# Altium schematic sheet Power_management.SchDoc: =DT_SCH_Title
size A3; Organization: Droid Technologies; SheetNumber: 5; SheetTotal: 22
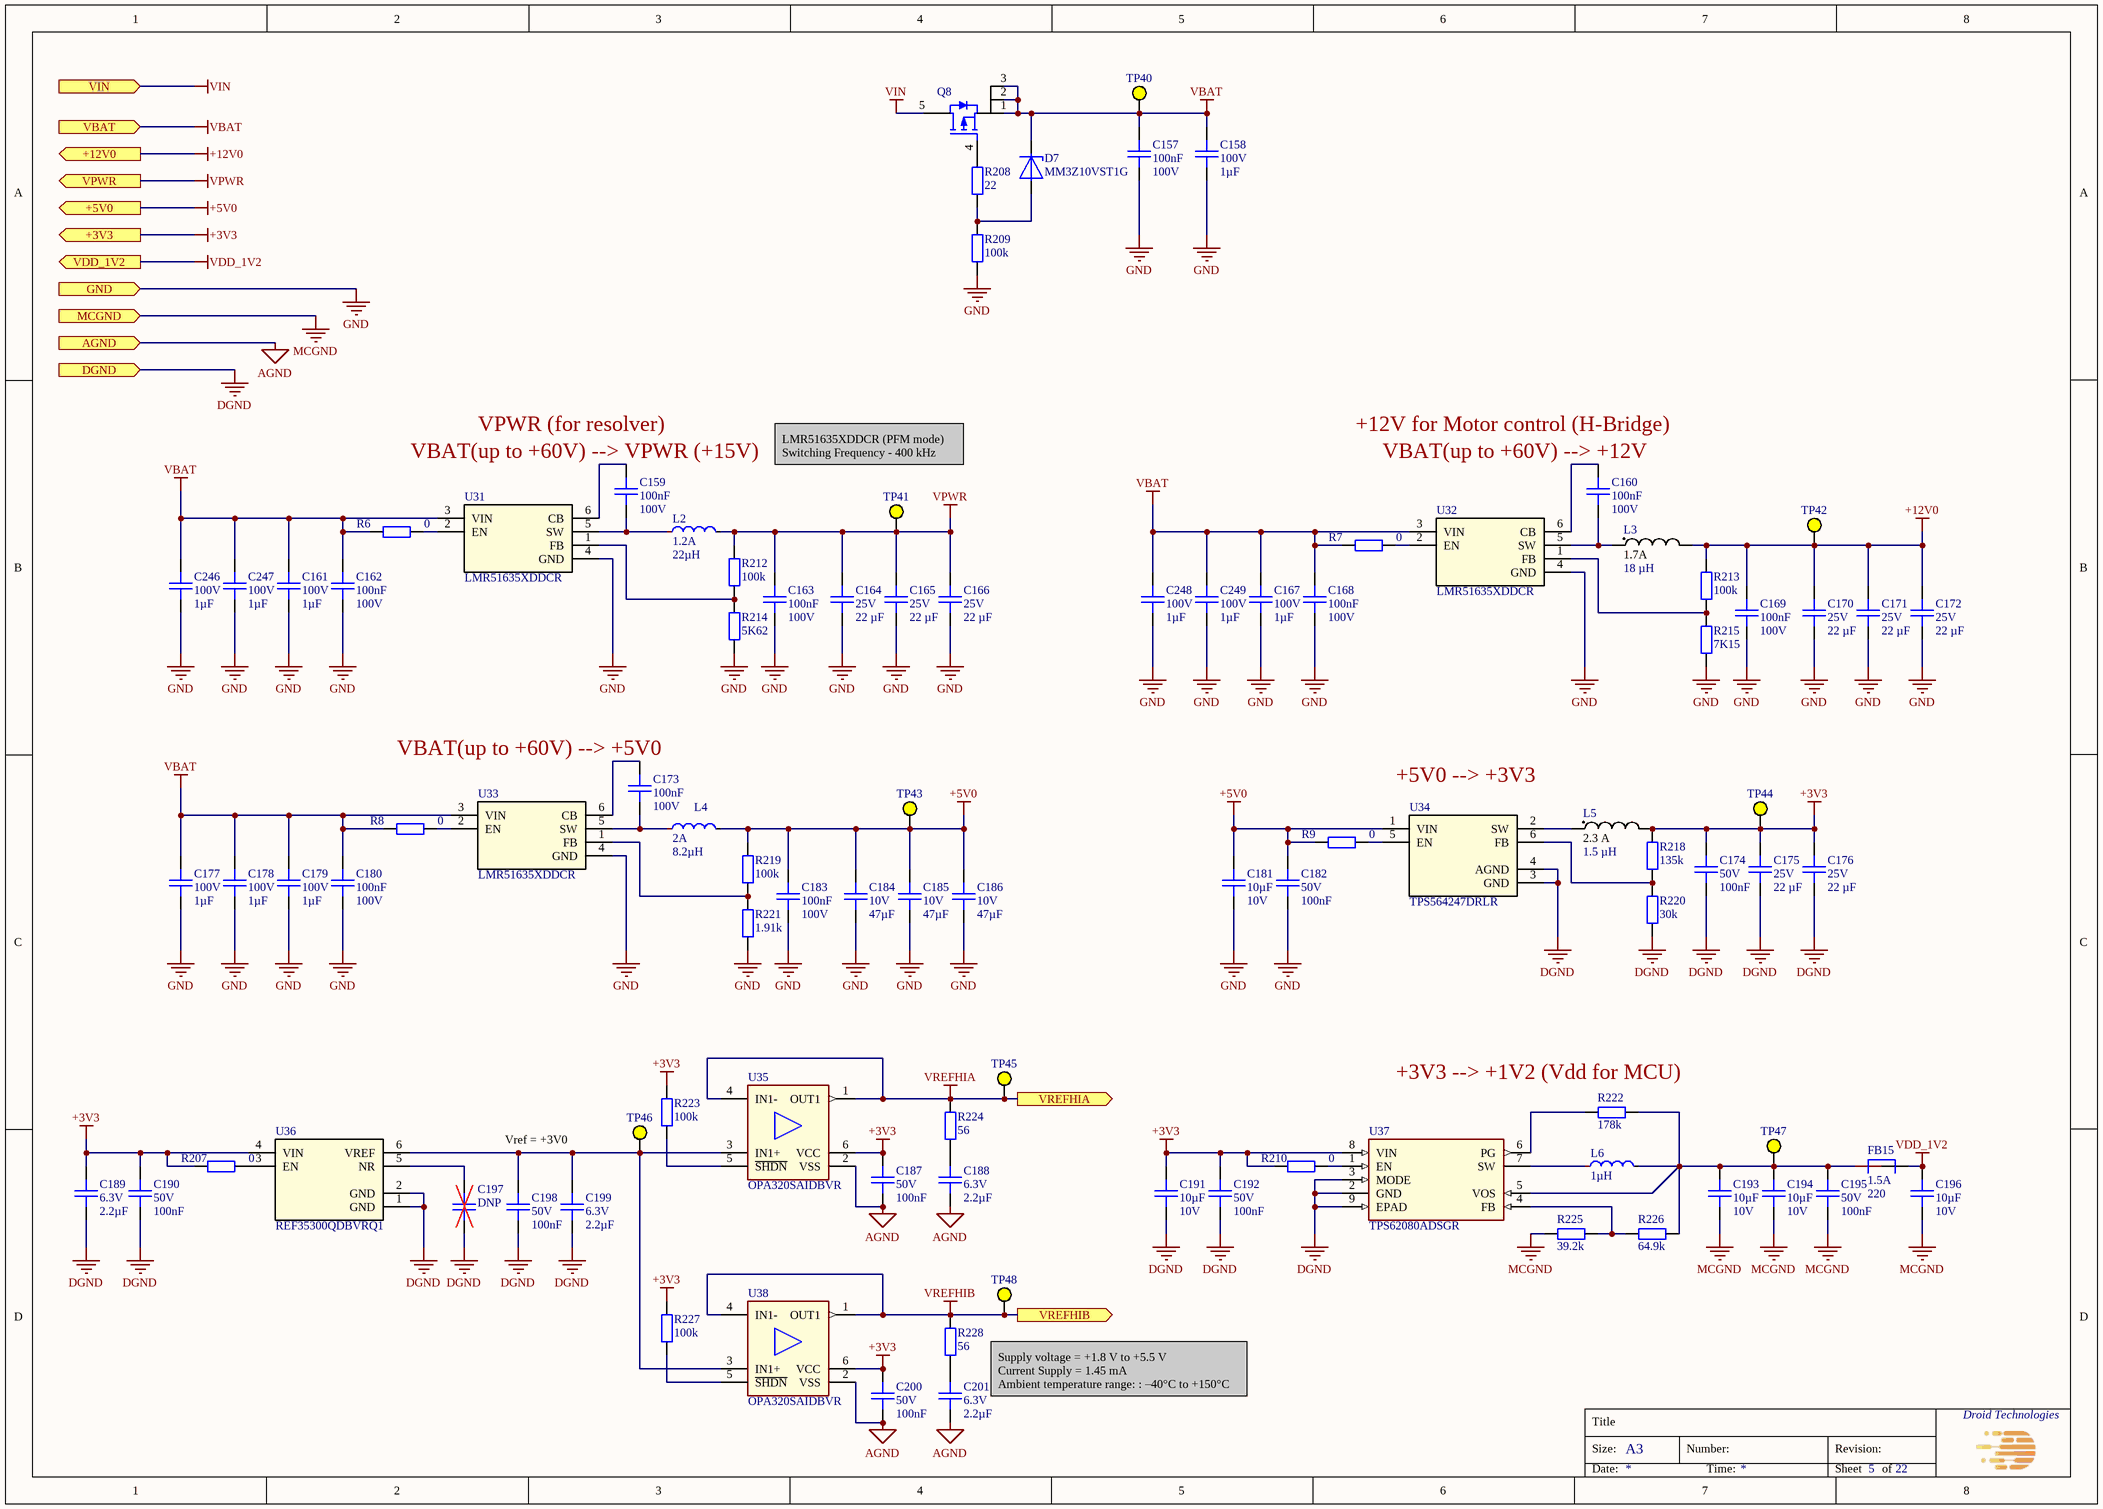
[diagram p0: Power_management.SchDoc]

## Parts
C157  Capacitance: 100nF  Voltage Rating: 100V  [CAPC160X80X90L35]  (hidden comment: GCJ188L8EL104KA07D)
C158  Voltage Rating: 100V  Capacitance: 1µF  [CAPC3216X180N]  (hidden comment: GCJ31CL8EL105KA07L)
C159  Capacitance: 100nF  Voltage Rating: 100V  [CAPC160X80X90L35]  (hidden comment: GCJ188L8EL104KA07D)
C160  Capacitance: 100nF  Voltage Rating: 100V  [CAPC160X80X90L35]  (hidden comment: GCJ188L8EL104KA07D)
C161  Voltage Rating: 100V  Capacitance: 1µF  [CAPC3216X180N]  (hidden comment: GCJ31CL8EL105KA07L)
C162  Capacitance: 100nF  Voltage Rating: 100V  [CAPC160X80X90L35]  (hidden comment: GCJ188L8EL104KA07D)
C163  Capacitance: 100nF  Voltage Rating: 100V  [CAPC160X80X90L35]  (hidden comment: GCJ188L8EL104KA07D)
C164  Voltage Rating: 25V  Capacitance: 22 µF  [CAPC3225_GCM32ER71E106KA57L]  (hidden comment: GCM32EL8EF226KE08L)
C165  Voltage Rating: 25V  Capacitance: 22 µF  [CAPC3225_GCM32ER71E106KA57L]  (hidden comment: GCM32EL8EF226KE08L)
C166  Voltage Rating: 25V  Capacitance: 22 µF  [CAPC3225_GCM32ER71E106KA57L]  (hidden comment: GCM32EL8EF226KE08L)
C167  Voltage Rating: 100V  Capacitance: 1µF  [CAPC3216X180N]  (hidden comment: GCJ31CL8EL105KA07L)
C168  Capacitance: 100nF  Voltage Rating: 100V  [CAPC160X80X90L35]  (hidden comment: GCJ188L8EL104KA07D)
C169  Capacitance: 100nF  Voltage Rating: 100V  [CAPC160X80X90L35]  (hidden comment: GCJ188L8EL104KA07D)
C170  Voltage Rating: 25V  Capacitance: 22 µF  [CAPC3225_GCM32ER71E106KA57L]  (hidden comment: GCM32EL8EF226KE08L)
C171  Voltage Rating: 25V  Capacitance: 22 µF  [CAPC3225_GCM32ER71E106KA57L]  (hidden comment: GCM32EL8EF226KE08L)
C172  Voltage Rating: 25V  Capacitance: 22 µF  [CAPC3225_GCM32ER71E106KA57L]  (hidden comment: GCM32EL8EF226KE08L)
C173  Capacitance: 100nF  Voltage Rating: 100V  [CAPC160X80X90L35]  (hidden comment: GCJ188L8EL104KA07D)
C174  Voltage Rating: 50V  Capacitance: 100nF  [CAPC100x50x50L25]  (hidden comment: GCM155L8EH104KE07D)
C175  Voltage Rating: 25V  Capacitance: 22 µF  [CAPC3225_GCM32ER71E106KA57L]  (hidden comment: GCM32EL8EF226KE08L)
C176  Voltage Rating: 25V  Capacitance: 22 µF  [CAPC3225_GCM32ER71E106KA57L]  (hidden comment: GCM32EL8EF226KE08L)
C177  Voltage Rating: 100V  Capacitance: 1µF  [CAPC3216X180N]  (hidden comment: GCJ31CL8EL105KA07L)
C178  Voltage Rating: 100V  Capacitance: 1µF  [CAPC3216X180N]  (hidden comment: GCJ31CL8EL105KA07L)
C179  Voltage Rating: 100V  Capacitance: 1µF  [CAPC3216X180N]  (hidden comment: GCJ31CL8EL105KA07L)
C180  Capacitance: 100nF  Voltage Rating: 100V  [CAPC160X80X90L35]  (hidden comment: GCJ188L8EL104KA07D)
C181  Capacitance: 10µF  Voltage Rating: 10V  [CAPC200X125X145L50]  (hidden comment: CGA4J1X8L1A106K125AC)
C182  Voltage Rating: 50V  Capacitance: 100nF  [CAPC100x50x50L25]  (hidden comment: GCM155L8EH104KE07D)
C183  Capacitance: 100nF  Voltage Rating: 100V  [CAPC160X80X90L35]  (hidden comment: GCJ188L8EL104KA07D)
C184  Voltage Rating: 10V  Capacitance: 47µF  [CAP_C2220_DOUBLE_KEM]  (hidden comment: C2220C476M8N2CAUTO)
C185  Voltage Rating: 10V  Capacitance: 47µF  [CAP_C2220_DOUBLE_KEM]  (hidden comment: C2220C476M8N2CAUTO)
C186  Voltage Rating: 10V  Capacitance: 47µF  [CAP_C2220_DOUBLE_KEM]  (hidden comment: C2220C476M8N2CAUTO)
C187  Voltage Rating: 50V  Capacitance: 100nF  [CAPC100x50x50L25]  (hidden comment: GCM155L8EH104KE07D)
C188  Voltage Rating: 6.3V  Capacitance: 2.2µF  [CAPC160X80X90L35]  (hidden comment: C1608X8L0J225K080AC)
C189  Voltage Rating: 6.3V  Capacitance: 2.2µF  [CAPC160X80X90L35]  (hidden comment: C1608X8L0J225K080AC)
C190  Voltage Rating: 50V  Capacitance: 100nF  [CAPC100x50x50L25]  (hidden comment: GCM155L8EH104KE07D)
C191  Capacitance: 10µF  Voltage Rating: 10V  [CAPC200X125X145L50]  (hidden comment: CGA4J1X8L1A106K125AC)
C192  Voltage Rating: 50V  Capacitance: 100nF  [CAPC100x50x50L25]  (hidden comment: GCM155L8EH104KE07D)
C193  Capacitance: 10µF  Voltage Rating: 10V  [CAPC200X125X145L50]  (hidden comment: CGA4J1X8L1A106K125AC)
C194  Capacitance: 10µF  Voltage Rating: 10V  [CAPC200X125X145L50]  (hidden comment: CGA4J1X8L1A106K125AC)
C195  Voltage Rating: 50V  Capacitance: 100nF  [CAPC100x50x50L25]  (hidden comment: GCM155L8EH104KE07D)
C196  Capacitance: 10µF  Voltage Rating: 10V  [CAPC200X125X145L50]  (hidden comment: CGA4J1X8L1A106K125AC)
C197  Capacitance: DNP  [CAPC100x50x50L25]  (hidden comment: DNP chip cap 0402)
C198  Voltage Rating: 50V  Capacitance: 100nF  [CAPC100x50x50L25]  (hidden comment: GCM155L8EH104KE07D)
C199  Voltage Rating: 6.3V  Capacitance: 2.2µF  [CAPC160X80X90L35]  (hidden comment: C1608X8L0J225K080AC)
C200  Voltage Rating: 50V  Capacitance: 100nF  [CAPC100x50x50L25]  (hidden comment: GCM155L8EH104KE07D)
C201  Voltage Rating: 6.3V  Capacitance: 2.2µF  [CAPC160X80X90L35]  (hidden comment: C1608X8L0J225K080AC)
C246  Voltage Rating: 100V  Capacitance: 1µF  [CAPC3216X180N]  (hidden comment: GCJ31CL8EL105KA07L)
C247  Voltage Rating: 100V  Capacitance: 1µF  [CAPC3216X180N]  (hidden comment: GCJ31CL8EL105KA07L)
C248  Voltage Rating: 100V  Capacitance: 1µF  [CAPC3216X180N]  (hidden comment: GCJ31CL8EL105KA07L)
C249  Voltage Rating: 100V  Capacitance: 1µF  [CAPC3216X180N]  (hidden comment: GCJ31CL8EL105KA07L)
D7  MM3Z10VST1G  [SOD250X125X110L30X40]
FB15  Imax: 1.5A  Impedance: 220  [BEADC160X80X95L40]  (hidden comment: BLM18KG221BH1D)
L2  I: 1.2A  Inductance: 22µH  [BOURNS_SRP4020TA]  (hidden comment: SRP4020TA-220M)
L3  Current Rating (Amps): 1.7A  Inductance: 18 µH  [IND_SRR4828A180M]  (hidden comment: SRR4828A-180M)
L4  I: 2A  Inductance: 8.2µH  [BOURNS_SRP4020TA]  (hidden comment: SRP4020TA-8R2M)
L5  Current Rating (Amps): 2.3 A  Inductance: 1.5 µH  [IND_DFE2HCAH1R0MJ0L]  (hidden comment: DFE2HCAH1R5MJ0L)
L6  Inductance: 1µH  [INDC250X200X120L60]  (hidden comment: DFE2HCAH1R0MJ0L)
Q8  SQJ185ELP-T1_GE3  [POWERPAK SO-8L_VIS]  (value not drawn)
R6  Resistance: 0  [RESC100X50X40L25]  (hidden comment: RC0402FR-070RL)
R7  Resistance: 0  [RESC100X50X40L25]  (hidden comment: RC0402FR-070RL)
R8  Resistance: 0  [RESC100X50X40L25]  (hidden comment: RC0402FR-070RL)
R9  Resistance: 0  [RESC100X50X40L25]  (hidden comment: RC0402FR-070RL)
R207  Resistance: 0  [RESC100X50X40L25]  (hidden comment: RC0402FR-070RL)
R208  Resistance: 22  [RESC100X50X40L25]  (hidden comment: RC0402FR-0722RL)
R209  Resistance: 100k  [RESC100X50X40L25]  (hidden comment: RC0402FR-07100KL)
R210  Resistance: 0  [RESC100X50X40L25]  (hidden comment: RC0402FR-070RL)
R212  Resistance: 100k  [RESC100X50X40L25]  (hidden comment: RC0402FR-07100KL)
R213  Resistance: 100k  [RESC100X50X40L25]  (hidden comment: RC0402FR-07100KL)
R214  Resistance: 5K62  [RC0402N_PAN]  (hidden comment: ERJ-2RKF5621X)
R215  Resistance: 7K15  [RC0402N_PAN]  (hidden comment: ERJ-2RKF7151X)
R218  Resistance: 135k  [RESC100X50X40L25]  (hidden comment: RN73H1ETTP1353F50)
R219  Resistance: 100k  [RESC100X50X40L25]  (hidden comment: RC0402FR-07100KL)
R220  Resistance: 30k  [RESC100X50X40L25]  (hidden comment: RC0402FR-0730KL)
R221  Resistance: 1.91k  [RESC100X50X40L25]  (hidden comment: RC0402FR-071K91L)
R222  Resistance: 178k  [RESC100X50X40L25]  (hidden comment: RC0402FR-07178KL)
R223  Resistance: 100k  [RESC100X50X40L25]  (hidden comment: RC0402FR-07100KL)
R224  Resistance: 56  [RESC100X50X40L25]  (hidden comment: RC0402FR-0756RL)
R225  Resistance: 39.2k  [RESC100X50X40L25]  (hidden comment: RMCF0402FT39K2)
R226  Resistance: 64.9k  [RESC100X50X40L25]  (hidden comment: RC0402FR-0764K9L)
R227  Resistance: 100k  [RESC100X50X40L25]  (hidden comment: RC0402FR-07100KL)
R228  Resistance: 56  [RESC100X50X40L25]  (hidden comment: RC0402FR-0756RL)
TP40  Test Point  [TP_D0.75mm]  (value not drawn)  (no BOM)
TP41  Test Point  [TP_D0.75mm]  (value not drawn)  (no BOM)
TP42  Test Point  [TP_D0.75mm]  (value not drawn)  (no BOM)
TP43  Test Point  [TP_D0.75mm]  (value not drawn)  (no BOM)
TP44  Test Point  [TP_D0.75mm]  (value not drawn)  (no BOM)
TP45  Test Point  [TP_D0.75mm]  (value not drawn)  (no BOM)
TP46  Test Point  [TP_D0.75mm]  (value not drawn)  (no BOM)
TP47  Test Point  [TP_D0.75mm]  (value not drawn)  (no BOM)
TP48  Test Point  [TP_D0.75mm]  (value not drawn)  (no BOM)
U31  LMR51635XDDCR  [DDC0006A-MFG]
U32  LMR51635XDDCR  [DDC0006A-MFG]
U33  LMR51635XDDCR  [DDC0006A-MFG]
U34  TPS564247DRLR  [SOT5x3-6_DRL_TEX]
U35  OPA320SAIDBVR  [SOT-23-6]
U36  REF35300QDBVRQ1  [SOT23-6_DBV_TEX]
U37  TPS62080ADSGR  [WSON (8) 2*2mm]
U38  OPA320SAIDBVR  [SOT-23-6]

## Ports
+3V3 (out), +5V0 (out), +12V0 (out), AGND (in), DGND (in), GND (in), MCGND (in), VBAT (in), VDD_1V2 (out), VIN (in), VPWR (out), VREFHIA (out), VREFHIB (out)

## Nets
+3V3: C174.2 C175.2 C176.2 C187.2 C189.2 C190.2 C191.2 C192.2 C200.2 L5.2 R207.1 R210.1 R218.2 R223.2 R227.2 TP44.1 U35.6(VCC) U36.4(VIN) U37.8(VIN) U38.6(VCC) ; port +3V3
+5V0: C181.2 C182.2 C183.2 C184.2 C185.2 C186.2 L4.2 R9.1 R219.2 TP43.1 U34.1(VIN) ; port +5V0
+12V0: C169.2 C170.2 C171.2 C172.2 L3.2 R213.2 TP42.1 ; port +12V0
AGND: C187.1 C188.1 C200.1 C201.1 U35.2(VSS) U38.2(VSS) ; port AGND
DGND: C174.1 C175.1 C176.1 C189.1 C190.1 C191.1 C192.1 C197.1 C198.1 C199.1 R220.1 U34.3(GND) U34.4(AGND) U36.1(GND) U36.2(GND) U37.2(GND) U37.3(MODE) U37.9(EPAD) ; port DGND
GND: C157.1 C158.1 C161.1 C162.1 C163.1 C164.1 C165.1 C166.1 C167.1 C168.1 C169.1 C170.1 C171.1 C172.1 C177.1 C178.1 C179.1 C180.1 C181.1 C182.1 C183.1 C184.1 C185.1 C186.1 C246.1 C247.1 C248.1 C249.1 R209.1 R214.1 R215.1 R221.1 U31.4(GND) U32.4(GND) U33.4(GND) ; port GND
MCGND: C193.1 C194.1 C195.1 C196.1 R225.1 ; port MCGND
VBAT: C157.2 C158.2 C161.2 C162.2 C167.2 C168.2 C177.2 C178.2 C179.2 C180.2 C246.2 C247.2 C248.2 C249.2 D7.1 Q8.1 Q8.2 Q8.3 R6.1 R7.1 R8.1 TP40.1 U31.3(VIN) U32.3(VIN) U33.3(VIN) ; port VBAT
VDD_1V2: C196.2 FB15.2 ; port VDD_1V2
VIN: Q8.5 ; port VIN
VPWR: C163.2 C164.2 C165.2 C166.2 L2.2 R212.2 TP41.1 ; port VPWR
VREFHIA: R224.2 TP45.1 U35.1(OUT1) U35.4(IN1-) ; port VREFHIA
VREFHIB: R228.2 TP48.1 U38.1(OUT1) U38.4(IN1-) ; port VREFHIB
NetC159_1: C159.1 L2.1 U31.5(SW)
NetC159_2: C159.2 U31.6(CB)
NetC160_1: C160.1 L3.1 U32.5(SW)
NetC160_2: C160.2 U32.6(CB)
NetC173_1: C173.1 L4.1 U33.5(SW)
NetC173_2: C173.2 U33.6(CB)
NetC188_2: C188.2 R224.1
NetC193_2: C193.2 C194.2 C195.2 FB15.1 L6.2 R222.2 R226.2 TP47.1 U37.5(VOS)
NetC197_2: C197.2 U36.5(NR)
NetC198_2: C198.2 C199.2 TP46.1 U35.3(IN1+) U36.6(VREF) U38.3(IN1+)
NetC201_2: C201.2 R228.1
NetD7_2: D7.2 R208.1 R209.2
NetL5_1: L5.1 U34.2(SW)
NetL6_1: L6.1 U37.7(SW)
NetQ8_4: Q8.4 R208.2
NetR6_2: R6.2 U31.2(EN)
NetR7_2: R7.2 U32.2(EN)
NetR8_2: R8.2 U33.2(EN)
NetR9_2: R9.2 U34.5(EN)
NetR207_2: R207.2 U36.3(EN)
NetR210_2: R210.2 U37.1(EN)
NetR212_1: R212.1 R214.2 U31.1(FB)
NetR213_1: R213.1 R215.2 U32.1(FB)
NetR218_1: R218.1 R220.2 U34.6(FB)
NetR219_1: R219.1 R221.2 U33.1(FB)
NetR222_1: R222.1 U37.6(PG)
NetR223_1: R223.1 U35.5(~{SHDN})
NetR225_2: R225.2 R226.1 U37.4(FB)
NetR227_1: R227.1 U38.5(~{SHDN})

## Notes on the sheet
- (near C159) VBAT(up to +60V) --> VPWR (+15V)
- (near C159) VPWR (for resolver)
- (near C160) +12V for Motor control (H-Bridge)
- (near C160) VBAT(up to +60V) --> +12V
- LMR51635XDDCR (PFM mode)
  Switching Frequency - 400 kHz
- (near C173) VBAT(up to +60V) --> +5V0
- +5V0 --> +3V3
- (near R222) +3V3 --> +1V2 (Vdd for MCU)
- Vref = +3V0
- Supply voltage = +1.8 V to +5.5 V
  Current Supply = 1.45 mA
  Ambient temperature range: : –40°C to +150°C
- Title
- Size:
- A3
- Number:
- Revision:
- Date:
- Time:
- Sheet
- of

## Library data of the parts
C157 C159 C160 C162 C163 C168 C169 C173 C180 C183 = CMP-001-2003-2: CAP CER 0.1UF 100V X8L 0603; Manufacturer: Murata Electronics; Tolerance: 10%; Op Temp min: -55°C; Op Temp max: 150°C; Package: 0603 (1608 Metric); ComponentLink3URL: https://www.digikey.com/en/products/detail/murata-electronics/GCJ188L8EL104KA07D/11618648; Lead Spacing: 0mm; ComponentLink1Description: Datasheet; ComponentLink1URL: https://www.murata.com/en-us/products/productdetail?partno=GCJ188L8EL104KA07%23; ComponentLink3Description: Digikey; MPN: GCJ188L8EL104KA07D; Ratings: AEC-Q200; ComponentLink2Description: Mouser; Height max: 900µm; Dielectric: X8L; Mounting Type: SM; ComponentLink2URL: https://eu.mouser.com/ProductDetail/Murata-Electronics/GCJ188L8EL104KA07D?qs=rrS6PyfT74fTpbPMbkPm2A%3D%3D; Size: 1.60mm x 0.80mm
C158 C161 C167 C177-C179 C246-C249 = CAP_1206_GCJ31CL8EL105KA07L: CAP CER 1UF 100V X8L 1206; Manufacturer: Murata Electronics; Op Temp max: 150°C; Op Temp min: -55°C; Tolerance: ±10%; ComponentLink3URL: https://www.digikey.gr/en/products/detail/murata-electronics/GCJ31CL8EL105KA07L/11618584; MPN: GCJ31CL8EL105KA07L; ComponentLink1URL: https://www.murata.com/en-sg/api/pdfdownloadapi?cate=luCeramicCapacitorsSMD&partno=GCJ31CL8EL105KA07%23; Package: 1206 (3216 Metric); Size: 3.20mm x 1.60mm; Height max: 1.90mm; Mounting Type: SM; ComponentLink1Description: Datasheet; ComponentLink3Description: Digikey; Ratings: AEC-Q200; Dielectric: X8L; Lead Spacing: -; Component Type: Ceramic Capacitor; Features: Soft Termination; ComponentLink4Description: Mouser; ComponentLink4URL: https://eu.mouser.com/ProductDetail/Murata-Electronics/GCJ31CL8EL105KA07L?qs=rrS6PyfT74eZHHvssdJSWA%3D%3D
C164-C166 C170-C172 C175 C176 = CAP_1210_GCM32EL8EF226KE08L: CAP CER 22UF 25V X8L 1210; Manufacturer: Murata Electronics; Op Temp max: 150°C; Op Temp min: -55°C; Tolerance: ±10%; ComponentLink3URL: https://www.digikey.gr/en/products/detail/murata-electronics/GCM32EL8EF226KE08L/10691974; MPN: GCM32EL8EF226KE08L; ComponentLink1URL: https://search.murata.co.jp/Ceramy/image/img/A01X/G101/ENG/GCM32EL8EF226KE08-01A.pdf; Package: 1210 (3225 Metric); Size: 3.20mm x 2.50mm; Height max: 2.85mm; Mounting Type: SM; ComponentLink1Description: Datasheet; ComponentLink3Description: Digikey; Ratings: AEC-Q200; Dielectric: X8L; Lead Spacing: -; Component Type: Ceramic Capacitor; ComponentLink4Description: Mouser; ComponentLink4URL: https://eu.mouser.com/ProductDetail/Murata-Electronics/GCM32EL8EF226KE08L?qs=rrS6PyfT74dnuZSDrFnfTA%3D%3D
C174 C182 C187 C190 C192 C195 C198 C200 = CMP-001-1980-2: CAP CER 0.1UF 50V X8L 0402; Manufacturer: Murata Electronics; Op Temp max: 150°C; Op Temp min: -55°C; Tolerance: 10%; Height max: 550µm; ComponentLink3Description: Digikey; Mounting Type: SM; ComponentLink3URL: https://www.digikey.com/en/products/detail/murata-electronics/GCM155L8EH104KE07D/11618823; Package: 0402 (1005 Metric); Lead Spacing: 0mm; MPN: GCM155L8EH104KE07D; Size: 1.00mm x 0.50mm; Ratings: AEC-Q200; ComponentLink1URL: https://www.murata.com/en-us/products/productdetail?partno=GCM155L8EH104KE07%23; ComponentLink1Description: Datasheet; Dielectric: X8L; ComponentLink2Description: Mouser; ComponentLink2URL: https://eu.mouser.com/ProductDetail/Murata-Electronics/GCM155L8EH104KE07D?qs=1mbolxNpo8fQSHf0HYnZWw%3D%3D
C181 C191 C193 C194 C196 = CMP-001-1984-2: CAP CER 10UF 10V X8L 0805; Manufacturer: TDK Corporation; Tolerance: 10%; Op Temp min: -55°C; Op Temp max: 150°C; ComponentLink3Description: Digikey; Mounting Type: SM; Ratings: AEC-Q200; ComponentLink1Description: Datasheet; ComponentLink3URL: https://www.digikey.com/en/products/detail/tdk-corporation/CGA4J1X8L1A106K125AC/9991388; Lead Spacing: 0mm; MPN: CGA4J1X8L1A106K125AC; Size: 2.00mm x 1.25mm; Height max: 1.5mm; ComponentLink2URL: https://eu.mouser.com/ProductDetail/TDK/CGA4J1X8L1A106K125AC?qs=gZXFycFWdANzH%252B2UvJJjtQ%3D%3D; Package: 0805 (2012 Metric); ComponentLink2Description: Mouser; Dielectric: X8L; ComponentLink1URL: https://product.tdk.com/en/search/capacitor/ceramic/mlcc/info?part_no=CGA4J1X8L1A106K125AC
C184-C186 = CAP_2220_C2220C476M8N2CAUTO: CAP CER 47UF 10V X8L SMD; Manufacturer: KEMET; Op Temp max: 150°C; Op Temp min: -55°C; Tolerance: ±20%; ComponentLink3URL: https://www.digikey.gr/en/products/detail/kemet/C2220C476M8N2CAUTO/8342190; MPN: C2220C476M8N2CAUTO; ComponentLink1URL: https://content.kemet.com/datasheets/KEM_C1038_X8L_KPS_150C_SMD.pdf; Package: Stacked SMD, 2 J-Lead; Size: 6.00mm x 5.00mm; Height max: 5.50mm; Mounting Type: SM; ComponentLink1Description: Datasheet; ComponentLink3Description: Digikey; Ratings: AEC-Q200; Dielectric: X8L; Lead Spacing: 0mm; Component Type: Ceramic Capacitor; ComponentLink4Description: Mouser; ComponentLink4URL: https://eu.mouser.com/ProductDetail/KEMET/C2220C476M8N2CAUTO?qs=r5DSvlrkXmIgGb2bhHfNGg%3D%3D
C188 C189 C199 C201 = CMP-001-2044-2: CAP CER 2.2UF 6.3V X8L 0603; Manufacturer: TDK Corporation; Op Temp min: -55°C; Tolerance: 10%; Op Temp max: 150°C; ComponentLink1URL: https://product.tdk.com/en/search/capacitor/ceramic/mlcc/info?part_no=C1608X8L0J225K080AC; MPN: C1608X8L0J225K080AC; ComponentLink3URL: https://www.digikey.com/en/products/detail/tdk-corporation/C1608X8L0J225K080AC/8343784; ComponentLink1Description: Datasheet; Lead Spacing: 0mm; ComponentLink3Description: Digikey; Package: 0603 (1608 Metric); Height max: 900µm; Size: 1.60mm x 0.80mm; Dielectric: X8L; Ratings: -; Mounting Type: SM; ComponentLink2URL: https://eu.mouser.com/ProductDetail/TDK/C1608X8L0J225K080AC?qs=rrS6PyfT74dgREMaiAoT3Q%3D%3D; ComponentLink2Description: Mouser
C197 = CMP-00427-4: DNP cap 0402; Mounting Type: SM; Package: 0402 (1005 Metric); MPN: DNP
D7 = CMP-001-1211-3: DIODE ZENER 10V 300MW SOD323; Manufacturer: onsemi; Voltage - Forward (Vf) (Max) @ If: 900 mV @ 10 mA; Impedance (Max) (Zzt): 15; Op Temp min: -65°C; Tolerance: 2%; Op Temp max: 150°C; Current - Reverse Leakage @ Vr: 500 nA @ 6 V; ComponentLink1Description: Datasheet; Size: 2.50mm x 1.25mm; Voltage - Zener (Nom) (Vz): 10V; MPN: MM3Z10VST1G; ComponentLink2URL: https://eu.mouser.com/ProductDetail/onsemi/MM3Z10VST1G?qs=HVbQlW5zcXXzjT3ckAO0iA%3D%3D; Mounting Type: SM; Height max: 1.1mm; Power: 300mW; Package: SC-76, SOD-323; ComponentLink3Description: Digikey; ComponentLink1URL: https://www.onsemi.com/pdf/datasheet/mm3z2v4st1-d.pdf; ComponentLink2Description: Mouser; ComponentLink3URL: https://www.digikey.com/en/products/detail/on-semiconductor/MM3Z10VST1G/687052
FB15 = CMP-001-1981-1: FERRITE BEAD 220 OHM 0603 1LN; Manufacturer: Murata Electronics; DCR: 50m; Op Temp min: -55°C; Frequency: 100MHz; Op Temp max: 150°C; Number of Lines: 1; Mounting Type: SM; Size: 1.60mm x 0.80mm; ComponentLink2URL: https://eu.mouser.com/ProductDetail/Murata-Electronics/BLM18KG221BH1D?qs=sJ5gq5MLFXpgEHYBdWUtkQ%3D%3D; ComponentLink1Description: Datasheet; ComponentLink1URL: https://www.murata.com/en-us/products/productdata/8798137286686/QNFA9129.pdf; Lead Spacing: 0mm; Ratings: AEC-Q200; ComponentLink3Description: Digikey; ComponentLink3URL: https://www.digikey.com/en/products/detail/murata-electronics/BLM18KG221BH1D/6156000; Height max: 950µm; Package: 0603 (1608 Metric); ComponentLink2Description: Mouser; MPN: BLM18KG221BH1D
L2 = CMP-00887-1: FIXED IND 22UH 1.2A 500 MOHM SMD; Manufacturer: Bourns Inc.; Type: Drum Core, Wirewound; Op Temp max: 150°C; Fsr: 19MHz; DCR: 0.5; Shielding: Shielded; Material - Core: Carbonyl Powder; Tolerance: 20%; Isat: 1.4A; Op Temp min: -40°C; Mounting Type: SM; ComponentLink3URL: https://www.digikey.com/en/products/detail/bourns-inc/SRP4020TA-220M/6153694?s=N4IgTCBcDaIAQGUBKAFALABjBgKgQQFoxsBZEAXQF8g; MPN: SRP4020TA-220M; ComponentLink2URL: https://eu.mouser.com/ProductDetail/Bourns/SRP4020TA-220M?qs=6oMev5NRZMH3jbGE7KrwKQ%3D%3D; ComponentLink3Description: Digikey; Height max: 2mm; Ratings: AEC-Q200; ComponentLink1Description: Datasheet; Lead Spacing: 0mm; Size: 4.45mm x 4.06mm; ComponentLink1URL: https://www.bourns.com/docs/Product-Datasheets/SRP4020TA.pdf; Package: 2-SMD; ComponentLink2Description: Mouser
L3 = IND_SRR4828A-180M: FIXED IND 18UH 1.7A 160 MOHM SMD; Manufacturer: Bourns Inc.; Current - Saturation (Isat): 0.8A; Shielding: Shielded; Frequency - Self Resonant: 22MHz; Inductance Frequency - Test: 100 kHz; Type: Drum Core, Wirewound; Material - Core: Ferrite; Tolerance: ±20%; MPN: SRR4828A-180M; DC Resistance (DCR): 160mOhm; ComponentLink1Description: DigiKey; ComponentLink1URL: https://www.digikey.com/en/products/detail/bourns-inc/SRR4828A-180M/7556024; ComponentLink2Description: Datasheet; ComponentLink2URL: https://www.bourns.com/docs/Product-Datasheets/SRR4828A.pdf; Mounting Type: SM; Ratings: AEC-Q200; Q @ Freq: -; ComponentLink3Description: Mouser; ComponentLink3URL: https://eu.mouser.com/ProductDetail/Bourns/SRR4828A-180M?qs=EU6FO9ffTwc4nWVXADcZcw%3D%3D
L4 = CMP-00885-1: FIXED IND 8.2UH 2A 180 MOHM SMD; Manufacturer: Bourns Inc.; Type: Drum Core, Wirewound; Op Temp min: -40°C; Material - Core: Carbonyl Powder; DCR: 0.18; Op Temp max: 150°C; Tolerance: 20%; Isat: 2.5A; Fsr: 21MHz; Shielding: Shielded; Ratings: AEC-Q200; ComponentLink3Description: Digikey; ComponentLink2Description: Mouser; Height max: 2mm; Lead Spacing: 0mm; ComponentLink1Description: Datasheet; Package: 2-SMD; ComponentLink3URL: https://www.digikey.com/en/products/detail/bourns-inc/SRP4020TA-8R2M/4901009?s=N4IgTCBcDaIMoCUAKAWADGNAVAggWgA4EwBZEAXQF8g; ComponentLink2URL: https://eu.mouser.com/ProductDetail/Bourns/SRP4020TA-8R2M?qs=Ph8%2FHnX6CQwwXiBs8JjSfQ%3D%3D; Size: 4.45mm x 4.06mm; MPN: SRP4020TA-8R2M; ComponentLink1URL: https://www.bourns.com/docs/Product-Datasheets/SRP4020TA.pdf; Mounting Type: SM
L5 = IND_DFE2HCAH1R5MJ0L: FIXED IND 1.5UH 2.3A 74 MOHM SMD; Manufacturer: Murata Electronics; Current - Saturation (Isat): 2.9A; Shielding: Shielded; DC Resistance (DCR): 74mOhm Max; Inductance Frequency - Test: 1 MHz; Type: Drum Core, Wirewound; Material - Core: Metal; Tolerance: ±20%; MPN: DFE2HCAH1R5MJ0L; ComponentLink1Description: DigiKey; ComponentLink1URL: https://www.digikey.com/en/products/detail/murata-electronics/dfe2hcah1r5mj0l/10135181; ComponentLink2Description: Datasheet; ComponentLink2URL: https://search.murata.co.jp/Ceramy/image/img/P02/JETE243A-9105.pdf; Frequency - Self Resonant: -; Mounting Type: SM; Ratings: AEC-Q200; Q @ Freq: -; ComponentLink3Description: Mouser; ComponentLink3URL: https://eu.mouser.com/ProductDetail/Murata-Electronics/DFE2HCAH1R5MJ0L?qs=17u8i%2FzlE8%2F0ipe6qBF76g%3D%3D; Operating Temperature (MIN): -40°C; Operating Temperature (MAX): +150°C
L6 = CMP-001-2041-1: FIXED IND 1UH 3A 50 MOHM SMD; Manufacturer: Murata Electronics; Fsr: 79MHz; Shielding: Shielded; Material - Core: Metal; DCR: 50m; Type: Drum Core, Wirewound; Op Temp min: -40°C; Isat: 3.4A; Tolerance: 20%; Op Temp max: 150°C; Height max: 1.2mm; I: 3A; ComponentLink1URL: https://www.murata.com/en-us/products/productdetail?partno=DFE2HCAH1R0MJ0%23; ComponentLink1Description: Datasheet; Lead Spacing: 0mm; ComponentLink3URL: https://www.digikey.com/en/products/detail/murata-electronics/DFE2HCAH1R0MJ0L/10135180; ComponentLink2URL: https://eu.mouser.com/ProductDetail/Murata-Electronics/DFE2HCAH1R0MJ0L?qs=17u8i%2FzlE8%2FsfvqDr48AMQ%3D%3D; Ratings: AEC-Q200; ComponentLink3Description: Digikey; Package: 1008 (2520 Metric); ComponentLink2Description: Mouser; MPN: DFE2HCAH1R0MJ0L; Size: 2.50mm x 2.00mm; Mounting Type: SM
Q8 = Q_SQJ185ELP-T1_GE3: MOSFETs P-CHANNEL 80-V (D-S) 175C MOSFET; Manufacturer: Vishay Siliconix; Vgs (Max): ±20V; Drive Voltage (Max Rds On, Min Rds On): -4.5V, -10V; Current - Continuous Drain (Id) @ 25°C: 62 A; Drain to Source Voltage (Vdss): 80 V; Input Capacitance (Ciss) (Max) @ Vds: 3510 pF @ -25 V; Power Dissipation (Max): 145 W; Rds On - Drain-Source Resistance:: 19.5 mOhms; MPN: SQJ185ELP-T1_GE3; FET Type: P-Channel; Ratings: AEC-Q101; Package / Case: PowerPAK® SO-8L; ComponentLink1Description: Datasheet; ComponentLink1URL: https://www.vishay.com/docs/62115/sqj185elp.pdf; ComponentLink2Description: DigiKey; ComponentLink3Description: Mouser; ComponentLink3URL: https://eu.mouser.com/ProductDetail/Vishay-Siliconix/SQJ185ELP-T1_GE3?qs=ZcfC38r4Posh2dea%252BP4W4A%3D%3D
R6-R9 R207 R210 = CMP-001-0208-12: RES SMD 0 OHM JUMPER 1/16W 0402; Manufacturer: YAGEO; Op Temp max: 155°C; Temperature Coefficient: ±100ppm; Op Temp min: -55°C; Tolerance: 0%; Power: 63mW; ComponentLink3URL: https://www.digikey.com/en/products/detail/yageo/RC0402FR-070RL/2827570; ComponentLink1Description: Datasheet; Composition: Thick Film; ComponentLink1URL: https://www.yageo.com/upload/media/product/productsearch/datasheet/rchip/PYu-RC_Group_51_RoHS_L_12.pdf; ComponentLink3Description: Digikey; Size: 1.00mm x 0.50mm; ComponentLink2Description: Mouser; Ratings: -; Package: 0402 (1005 Metric); MPN: RC0402FR-070RL; ComponentLink2URL: https://eu.mouser.com/ProductDetail/YAGEO/RC0402FR-070RL?qs=%2Fha2pyFaduhjtLcYvKXQ8C3M6h5LO%252B8bxxSVLF2BfkIYKpoExpS33A%3D%3D; Height max: 400µm; Mounting Type: SM
R208 = CMP-001-0482-4: RES 22 OHM 1% 1/16W 0402; Manufacturer: YAGEO; Temperature Coefficient: ±100ppm; Op Temp max: 155°C; Op Temp min: -55°C; Power: 63mW; Ratings: -; ComponentLink3URL: https://www.digikey.com/en/products/detail/yageo/RC0402FR-0722RL/726562; ComponentLink2URL: https://eu.mouser.com/ProductDetail/YAGEO/RC0402FR-0722RL?qs=V1yeUXFNrkkRg6zf08ADKQ%3D%3D; MPN: RC0402FR-0722RL; ComponentLink1Description: Datasheet; ComponentLink3Description: Digikey; Tolerance: 1%; Size: 1.00mm x 0.50mm; ComponentLink1URL: https://www.yageo.com/upload/media/product/productsearch/datasheet/rchip/PYu-RC_Group_51_RoHS_L_12.pdf; Composition: Thick Film; ComponentLink2Description: Mouser; Mounting Type: SM; Package: 0402 (1005 Metric); Height max: 400µm
R209 R212 R213 R219 R223 R227 = CMP-00121-6: RES 100K OHM 1% 1/16W 0402; Manufacturer: YAGEO; Op Temp min: -55°C; Op Temp max: 155°C; Power: 63mW; Temperature Coefficient: ±100ppm; ComponentLink2Description: Mouser; Mounting Type: SM; Composition: Thick Film; ComponentLink3URL: https://www.digikey.com/en/products/detail/yageo/RC0402FR-07100KL/726526; Size: 1.00mm x 0.50mm; MPN: RC0402FR-07100KL; Tolerance: 1%; Ratings: -; ComponentLink1Description: Datasheet; ComponentLink2URL: https://eu.mouser.com/ProductDetail/YAGEO/RC0402FR-07100KL?qs=%2Fha2pyFaduhjtLcYvKXQ8IUndG0u%252BuCx1gxMxvN%252Btd7iB7mgHWsSbw%3D%3D; Package: 0402 (1005 Metric); ComponentLink1URL: https://www.yageo.com/upload/media/product/productsearch/datasheet/rchip/PYu-RC_Group_51_RoHS_L_12.pdf; ComponentLink3Description: Digikey; Height max: 400µm
R214 = RC_0402_ERJ-2RKF5621X: RES SMD 5.62K OHM 1% 1/10W 0402; Manufacturer: Panasonic Electronic Components; Temperature Coefficient: ±100ppm/°C; Power: 0.1W, 1/10W; Op Temp min: -55°C; Op Temp max: 155°C; Ratings: Automotive AEC-Q200; Package: 0402 (1005 Metric); MPN: ERJ-2RKF5621X; Size: 1.00mm x 0.50mm; ComponentLink1Description: Datasheet; ComponentLink3Description: Digikey; ComponentLink2URL: https://eu.mouser.com/ProductDetail/Panasonic/ERJ-2RKF5621X?qs=YMBIwoNQYdVW%2FAKb0KIR9A%3D%3D; Mounting Type: SM; Composition: Thick Film; ComponentLink3URL: https://www.digikey.at/en/products/detail/panasonic-electronic-components/ERJ-2RKF5621X/192390?s=N4IgTCBcDaIKICUBSBaMCDSAxArANjAEYANEAXQF8g; Tolerance: 1%; Height max: 0.40mm; ComponentLink2Description: Mouser; ComponentLink1URL: https://industrial.panasonic.com/cdbs/www-data/pdf/RDA0000/AOA0000C304.pdf; Component Type: Chip Resistor
R215 = RC_0402_ERJ-2RKF7151X: RES SMD 7.15K OHM 1% 1/10W 0402; Manufacturer: Panasonic Electronic Components; Temperature Coefficient: ±100ppm/°C; Power: 0.1W, 1/10W; Op Temp min: -55°C; Op Temp max: 155°C; Ratings: Automotive AEC-Q200; Package: 0402 (1005 Metric); MPN: ERJ-2RKF7151X; Size: 1.00mm x 0.50mm; ComponentLink1Description: Datasheet; ComponentLink3Description: Digikey; ComponentLink2URL: https://eu.mouser.com/ProductDetail/Panasonic/ERJ-2RKF7151X?qs=iBwFsHVUAOeT%2FIodbHv05A%3D%3D; Mounting Type: SM; Composition: Thick Film; ComponentLink3URL: https://www.digikey.at/en/products/detail/panasonic-electronic-components/ERJ-2RKF7151X/192455?s=N4IgTCBcDaIKICUBSBaMCDSAxA7ARgFY8ANEAXQF8g; Tolerance: 1%; Height max: 0.40mm; ComponentLink2Description: Mouser; ComponentLink1URL: https://industrial.panasonic.com/cdbs/www-data/pdf/RDA0000/AOA0000C304.pdf; Component Type: Chip Resistor
R218 = CMP-001-0382-5: RES 135K OHM 1% 1/16W 0402; Manufacturer: KOA Speer Electronics, Inc.; Power: 63mW; Ratings: Automotive AEC-Q200, Moisture Resistant; Op Temp max: 155°C; Temperature Coefficient: ±100ppm; Op Temp min: -55°C; ComponentLink2URL: https://www.koaspeer.com/pdfs/RN73H.pdf; ComponentLink2Description: Mouser; Height max: 400µm; ComponentLink3Description: Digikey; Mounting Type: SM; Composition: Thick Film; Size: 1.00mm x 0.50mm; ComponentLink1URL: https://www.yageo.com/upload/media/product/productsearch/datasheet/rchip/PYu-RC_Group_51_RoHS_L_12.pdf; Tolerance: 1%; ComponentLink1Description: Datasheet; Package: 0402 (1005 Metric); ComponentLink3URL: https://www.digikey.at/en/products/detail/koa-speer-electronics-inc/RN73H1ETTP1353F50/9914841; MPN: RN73H1ETTP1353F50
R220 = CMP-001-0510-4: RES 30K OHM 1% 1/16W 0402; Manufacturer: YAGEO; Op Temp max: 155°C; Temperature Coefficient: ±100ppm; Power: 63mW; Op Temp min: -55°C; Tolerance: 1%; Composition: Thick Film; MPN: RC0402FR-0730KL; ComponentLink3Description: Digikey; Package: 0402 (1005 Metric); Size: 1.00mm x 0.50mm; Ratings: -; Mounting Type: SM; ComponentLink2Description: Mouser; ComponentLink3URL: https://www.digikey.com/en/products/detail/yageo/RC0402FR-0730KL/726586; ComponentLink1URL: https://www.yageo.com/upload/media/product/productsearch/datasheet/rchip/PYu-RC_Group_51_RoHS_L_12.pdf; Height max: 400µm; ComponentLink1Description: Datasheet; ComponentLink2URL: https://eu.mouser.com/ProductDetail/YAGEO/RC0402FR-0730KL?qs=YUgVZYePFqD%252BaGg4iT%252Br5g%3D%3D
R221 = CMP-00419-6: RES 1.91K OHM 1% 1/16W 0402; Manufacturer: YAGEO; Op Temp min: -55°C; Temperature Coefficient: ±100ppm; Op Temp max: 155°C; Power: 63mW; ComponentLink2Description: Mouser; ComponentLink1URL: https://www.yageo.com/upload/media/product/productsearch/datasheet/rchip/PYu-RC_Group_51_RoHS_L_12.pdf; ComponentLink3Description: Digikey; Composition: Thick Film; Tolerance: 1%; Ratings: -; Package: 0402 (1005 Metric); Mounting Type: SM; ComponentLink2URL: https://eu.mouser.com/ProductDetail/YAGEO/RC0402FR-071K91L?qs=%2Fha2pyFaduhjtLcYvKXQ8Exvf7RdQuNEJrJL9EjAZgPVltTSbbI12w%3D%3D; MPN: RC0402FR-071K91L; Height max: 400µm; ComponentLink3URL: https://www.digikey.com/en/products/detail/yageo/RC0402FR-071K91L/5280909; Size: 1.00mm x 0.50mm; ComponentLink1Description: Datasheet
R222 = CMP-00630-3: RES 178K OHM 1% 1/16W 0402; Manufacturer: YAGEO; Temperature Coefficient: ±100ppm; Power: 63mW; Op Temp min: -55°C; Op Temp max: 155°C; Size: 1.00mm x 0.50mm; Composition: Thick Film; ComponentLink3URL: https://www.digikey.com/en/products/detail/yageo/RC0402FR-07178KL/5280870?s=N4IgTCBcDaIEoGEAMAWJYBicC0SDsAjHgBwDSAMiALoC%2BQA; Tolerance: 1%; Package: 0402 (1005 Metric); ComponentLink3Description: Digikey; ComponentLink1Description: Datasheet; MPN: RC0402FR-07178KL; Mounting Type: SM; Ratings: -; ComponentLink1URL: https://www.yageo.com/upload/media/product/productsearch/datasheet/rchip/PYu-RC_Group_51_RoHS_L_12.pdf; ComponentLink2URL: https://eu.mouser.com/ProductDetail/YAGEO/RC0402FR-07178KL?qs=UOUeRUa%252B8WmEoK18p4ojZQ%3D%3D; Height max: 400µm; ComponentLink2Description: Mouser
R224 R228 = CMP-001-0492-6: RES 56 OHM 1% 1/16W 0402; Manufacturer: YAGEO; Op Temp min: -55°C; Temperature Coefficient: ±100ppm; Power: 63mW; Op Temp max: 155°C; Size: 1.00mm x 0.50mm; Mounting Type: SM; Height max: 400mm; ComponentLink3Description: Digikey; Tolerance: 1%; Ratings: -; MPN: RC0402FR-0756RL; ComponentLink1URL: https://www.yageo.com/upload/media/product/productsearch/datasheet/rchip/PYu-RC_Group_51_RoHS_L_12.pdf; ComponentLink3URL: https://www.digikey.com/en/products/detail/yageo/RC0402FR-0756RL/726636; ComponentLink2Description: Mouser; Composition: Thick Film; ComponentLink2URL: https://eu.mouser.com/ProductDetail/YAGEO/RC0402FR-0756RL?qs=V1yeUXFNrkmJal7VE1rFjw%3D%3D; ComponentLink1Description: Datasheet; Package: 0402 (1005 Metric)
R225 = CMP-001-2043-2: RES 39.2K OHM 1% 1/16W 0402; Manufacturer: Stackpole Electronics Inc; Op Temp min: -55°C; Temperature Coefficient: ±100ppm; Power: 63mW; Op Temp max: 155°C; ComponentLink1Description: Datasheet; Composition: Thick Film; ComponentLink1URL: https://www.seielect.com/catalog/sei-rmcf_rmcp.pdf; Package: 0402 (1005 Metric); ComponentLink3Description: Digikey; Tolerance: 1%; ComponentLink2Description: Mouser; MPN: RMCF0402FT39K2; Height max: 400µm; Ratings: AEC-Q200; ComponentLink2URL: https://eu.mouser.com/ProductDetail/SEI-Stackpole/RMCF0402FT39K2?qs=IPgv5n7u5QZ19xDSJPwVdQ%3D%3D; ComponentLink3URL: https://www.digikey.com/en/products/detail/stackpole-electronics-inc/RMCF0402FT39K2/1761390; Mounting Type: SM; Size: 1.00mm x 0.50mm
R226 = CMP-00721-2: RES 64.9K OHM 1% 1/16W 0402; Manufacturer: YAGEO; Temperature Coefficient: ±100ppm; Op Temp min: -55°C; Power: 63mW; Op Temp max: 155°C; Tolerance: 1%; Package: 0402 (1005 Metric); ComponentLink2URL: https://eu.mouser.com/ProductDetail/YAGEO/RC0402FR-0764K9L?qs=Is6ZsIPfHkbVUkOpst8WdA%3D%3D; MPN: RC0402FR-0764K9L; ComponentLink1URL: https://www.yageo.com/upload/media/product/productsearch/datasheet/rchip/PYu-RC_Group_51_RoHS_L_12.pdf; ComponentLink2Description: Mouser; ComponentLink3Description: Digikey; ComponentLink3URL: https://www.digikey.com/en/products/detail/yageo/RC0402FR-0764K9L/726649?s=N4IgTCBcDaIEoGEAMAWJYBicC0SDsAbCgNICcAMiALoC%2BQA; Composition: Thick Film; ComponentLink1Description: Datasheet; Mounting Type: SM; Ratings: -; Size: 1.00mm x 0.50mm; Height max: 400µm
TP40-TP48 = TP_0.75: Test point 0.75mm
U31-U33 = LMR51635XDDCR: SIMPLE SWITCHER SYNCHRONOUS BUCK; Manufacturer: Texas Instruments; Function: Step-Down; Output Type: Adjustable; Voltage - Input (Min): 4.3V; Voltage - Input (Max): 60V; Voltage - Output (Min/Fixed): 0.8V; Voltage - Output (Max): 30V; Current - Output: 3.5A; Frequency - Switching: 400kHz; Synchronous Rectifier: Yes; MPN: LMR51635XDDCR; Topology: Buck; Operating Temperature (MIN): -40°C  (TJ); Operating Temperature (MAX): 150°C (TJ); Mounting Type: SM; Package / Case: SOT-23-6 Thin, TSOT-23-6; ComponentLink1Description: Datasheet; ComponentLink1URL: https://www.ti.com/lit/ds/symlink/lmr51625.pdf?ts=1742888310253&ref_url=https%253A%252F%252Fwww.ti.com%252Fsitesearch%252Fen-us%252Fdocs%252Funiversalsearch.tsp%253FlangPref%253Den-US%2526nr%253D3%2526searchTerm%253DLMR51625XDDCR; ComponentLink2Description: DigiKey; ComponentLink2URL: https://www.digikey.com/en/products/detail/texas-instruments/LMR51635XDDCR/25811438?s=N4IgTCBcDaIDIFkBKBWAjANgMwoBoBF8BhJEAXQF8g; ComponentLink3Description: Mouser; ComponentLink3URL: https://eu.mouser.com/ProductDetail/Texas-Instruments/LMR51635XDDCR?qs=a2MtRaTmNORRY9iTmYV%2Fiw%3D%3D
U34 = TPS564247DRLR: IC REG BUCK ADJ 4A SOT563; Manufacturer: Texas Instruments; Function: Step-Down; Output Type: Adjustable; Voltage - Input (Min): 3V; Voltage - Input (Max): 16V; Voltage - Output (Min/Fixed): 0.6V; Voltage - Output (Max): 7V; Frequency - Switching: 1.2MHz; MPN: TPS564247DRLR; Topology: Buck; Current - Output: 4A; Operating Temperature (MIN): -40°C (TJ); Operating Temperature (MAX): 125°C (TJ); Mounting Type: SM; Package / Case: SOT-563, SOT-666; ComponentLink1Description: Datsheet; ComponentLink1URL: https://www.ti.com/lit/ds/symlink/tps564242.pdf?ts=1750029010480; ComponentLink2Description: DigiKey; ComponentLink2URL: https://www.digikey.at/en/products/detail/texas-instruments/TPS564247DRLR/16585672?s=N4IgTCBcDaICoAUDKBWAbAFjBg7CAugL5A; ComponentLink3Description: Mouser; ComponentLink3URL: https://eu.mouser.com/ProductDetail/Texas-Instruments/TPS564247DRLR?qs=tlsG%2FOw5FFiLH60bcMvlFQ%3D%3D
U35 U38 = OPA320SAIDBVR: CMOS Amplifier 1 Circuit Rail-to-Rail SOT-23-6; Manufacturer: Texas Instruments; MPN: OPA320SAIDBVR
U36 = IC_REF35300QDBVRQ1: IC VREF SERIES SOT23-6; Mfr_Name: Texas Instruments; Output Type: Fixed; Voltage - Output (Min/Fixed): 3V; Current - Output: 10 mA; Tolerance: ±0.05%; Temperature Coefficient: 15ppm/°C; Noise - 0.1Hz to 10Hz: 3.8ppmp-p; Noise - 10Hz to 10kHz: 0.7ppmrms; Voltage - Input: 3.25V ~ 6V; Current - Supply: 2.6µA; MPN: REF35300QDBVRQ1; Reference Type: Series; ComponentLink1Description: Datasheet; ComponentLink1URL: https://www.ti.com/lit/ds/symlink/ref35-q1.pdf?ts=1750582135074&ref_url=https%253A%252F%252Fwww.ti.com%252Fproduct%252FREF35-Q1; ComponentLink2Description: DigiKey; ComponentLink2URL: https://www.digikey.com/en/products/detail/texas-instruments/REF35300QDBVRQ1/21598116?s=N4IgTCBcDaIEoFEBiBmArCgDJgigEQCEA1OHARgAIQBdAXyA; ComponentLink3Description: Mouser; ComponentLink3URL: https://eu.mouser.com/ProductDetail/Texas-Instruments/REF35300QDBVRQ1?qs=HoCaDK9Nz5eVknlU2N7cQg%3D%3D; Operating Temperature (MIN): -40°C (TA); Operating Temperature (MAX): +125°C (TA); Ratings: AEC-Q100; Mounting Type: SM; Package / Case: SOT-23-6
U37 = TPS62080ADSGR: IC REG BUCK ADJ 1.2A 8WSON; Manufacturer: Texas Instruments; MPN: TPS62080ADSGR